# Altium schematic sheet IF_Amp.SchDoc
size A3; SheetNumber: 8; SheetTotal: 8
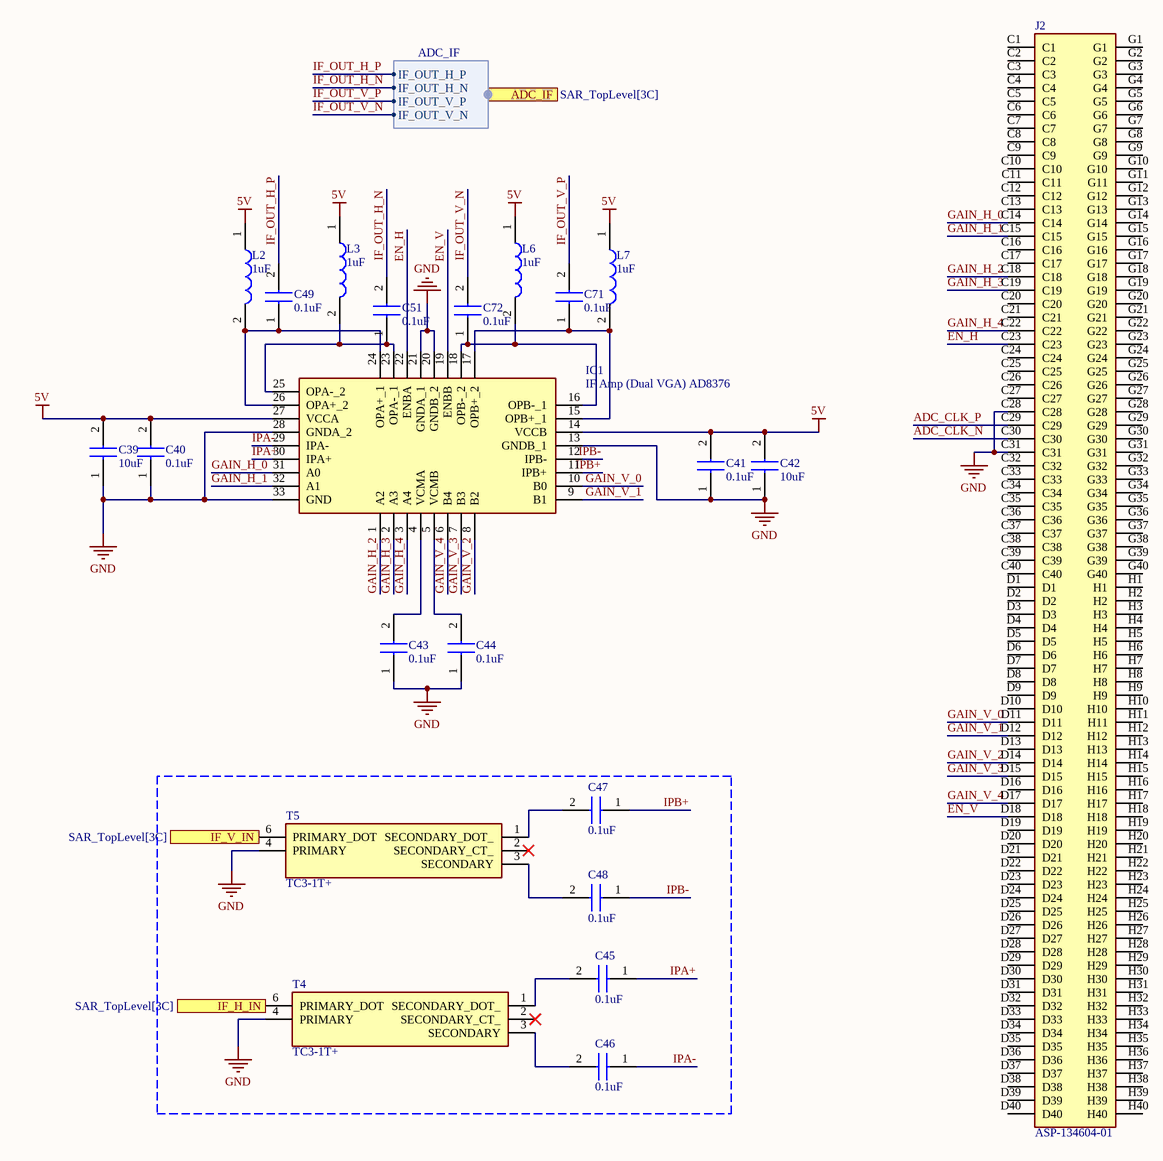
[diagram p0: IF_Amp.SchDoc]

## Parts
C39  10uF  [C1206_FT]
C40  0.1uF  [C0402C104J4RACTU]
C41  0.1uF  [C0402C104J4RACTU]
C42  10uF  [C1206_FT]
C43  0.1uF  [C0402C104J4RACTU]
C44  0.1uF  [C0402C104J4RACTU]
C45  0.1uF  [C0402C104J4RACTU]
C46  0.1uF  [C0402C104J4RACTU]
C47  0.1uF  [C0402C104J4RACTU]
C48  0.1uF  [C0402C104J4RACTU]
C49  0.1uF  [C0402C104J4RACTU]
C51  0.1uF  [C0402C104J4RACTU]
C71  0.1uF  [C0402C104J4RACTU]
C72  0.1uF  [C0402C104J4RACTU]
IC1  IF Amp (Dual VGA) AD8376  [QFN50P500X500X80-33N-D]
J2  ASP-134604-01  [ASP13460401]
L2  1uF  [7447610310]
L3  1uF  [7447610310]
L6  1uF  [7447610310]
L7  1uF  [7447610310]
T4  TC3-1T+  [TC31T]
T5  TC3-1T+  [TC31T]

## Ports
ADC_IF (harness ADC_IF, see SAR_TopLevel[3C]), IF_H_IN (in, see SAR_TopLevel[3C]), IF_V_IN (in, see SAR_TopLevel[3C])

## Harnesses
ADC_IF: IF_OUT_V_N, IF_OUT_H_N, IF_OUT_H_P, IF_OUT_V_P

## Nets
5V: C39.2 C40.2 C41.2 C42.2 IC1.14(VCCB) IC1.27(VCCA) L2.1 L3.1 L6.1 L7.1
GND: C39.1 C40.1 C41.1 C42.1 C43.1 C44.1 IC1.13(GNDB_1) IC1.20(GNDB_2) IC1.21(GNDA_1) IC1.28(GNDA_2) IC1.33(GND) J2.C28 J2.C31 T4.4(PRIMARY) T5.4(PRIMARY)
ADC_CLK_N: J2.C30
ADC_CLK_P: J2.C29
EN_H: IC1.22(ENBA) J2.C23
EN_V: IC1.19(ENBB) J2.D18
GAIN_H_0: IC1.31(A0) J2.C14
GAIN_H_1: IC1.32(A1) J2.C15
GAIN_H_2: IC1.1(A2) J2.C18
GAIN_H_3: IC1.2(A3) J2.C19
GAIN_H_4: IC1.3(A4) J2.C22
GAIN_V_0: IC1.10(B0) J2.D11
GAIN_V_1: IC1.9(B1) J2.D12
GAIN_V_2: IC1.8(B2) J2.D14
GAIN_V_3: IC1.7(B3) J2.D15
GAIN_V_4: IC1.6(B4) J2.D17
IF_H_IN: T4.6(PRIMARY_DOT) ; port IF_H_IN
IF_OUT_H_N: C51.2 ; port ADC_IF.IF_OUT_H_N
IF_OUT_H_P: C49.2 ; port ADC_IF.IF_OUT_H_P
IF_OUT_V_N: C72.2 ; port ADC_IF.IF_OUT_V_N
IF_OUT_V_P: C71.2 ; port ADC_IF.IF_OUT_V_P
IF_V_IN: T5.6(PRIMARY_DOT) ; port IF_V_IN
IPA+: C45.1 IC1.30(IPA+)
IPA-: C46.1 IC1.29(IPA-)
IPB+: C47.1 IC1.11(IPB+)
IPB-: C48.1 IC1.12(IPB-)
NetC43_2: C43.2 IC1.4(VCMA)
NetC44_2: C44.2 IC1.5(VCMB)
NetC45_2: C45.2 T4.1(SECONDARY_DOT_)
NetC46_2: C46.2 T4.3(SECONDARY)
NetC47_2: C47.2 T5.1(SECONDARY_DOT_)
NetC48_2: C48.2 T5.3(SECONDARY)
NetC49_1: C49.1 IC1.24(OPA+_1) IC1.26(OPA+_2) L2.2
NetC51_1: C51.1 IC1.23(OPA-_1) IC1.25(OPA-_2) L3.2
NetC71_1: C71.1 IC1.15(OPB+_1) IC1.17(OPB+_2) L7.2
NetC72_1: C72.1 IC1.16(OPB-_1) IC1.18(OPB-_2) L6.2

Not connected (* = marked no-connect by the designer): J2 C1 C2 C3 C4 C5 C6 C7 C8 C9 C10 C11 C12 C13 C16 C17 C20 C21 C24 C25 C26 C27 C32 C33 C34 C35 C36 C37 C38 C39 C40 D1 D2 D3 D4 D5 D6 D7 D8 D9 D10 D13 D16 D19 D20 D21 D22 D23 D24 D25 D26 D27 D28 D29 D30 D31 D32 D33 D34 D35 D36 D37 D38 D39 D40 G1 G2 G3 G4 G5 G6 G7 G8 G9 G10 G11 G12 G13 G14 G15 G16 G17 G18 G19 G20 G21 G22 G23 G24 G25 G26 G27 G28 G29 G30 G31 G32 G33 G34 G35 G36 G37 G38 G39 G40 H1 H2 H3 H4 H5 H6 H7 H8 H9 H10 H11 H12 H13 H14 H15 H16 H17 H18 H19 H20 H21 H22 H23 H24 H25 H26 H27 H28 H29 H30 H31 H32 H33 H34 H35 H36 H37 H38 H39 H40; T4 2(SECONDARY_CT_)*; T5 2(SECONDARY_CT_)*

## Library data of the parts
C39 C42 = 1206 10uF Capacitor: C1206X106M3RACAUTO; Manufacturer_Name: Yageo Group; Datasheet Link: https://www.yageogroup.com/content/datasheet/asset/file/KEM_C1078_X7R_FT-CAP_AUTO_SMD; Manufacturer_Part_Number: C1206X106M3RACAUTO; Mouser Part Number: 80-C1206X106M3RAUTO; Mouser Price/Stock: https://www.mouser.co.uk/ProductDetail/KEMET/C1206X106M3RACAUTO?qs=HXFqYaX1Q2xSroSoadzbnw%3D%3D; Arrow Part Number: C1206X106M3RACAUTO; Arrow Price/Stock: https://www.arrow.com/en/products/c1206x106m3racauto/kemet-corporation?utm_currency=USD&region=nac
C40 C41 C43-C49 C51 C71 C72 = 0402 0.1uF Capacitor: C0402C104K4RACTU; Manufacturer_Name: Yageo Group; Datasheet Link: https://content.kemet.com/datasheets/KEM_C1002_X7R_SMD.pdf; Height: 0.55mm; Manufacturer_Part_Number: C0402C104K4RACTU; Mouser Part Number: 80-C0402C104K4R; Mouser Price/Stock: https://www.mouser.co.uk/ProductDetail/KEMET/C0402C104K4RACTU?qs=DBJr%252BvBUjU54jK7d4uAeew%3D%3D; Arrow Part Number: C0402C104K4RACTU; Arrow Price/Stock: https://www.arrow.com/en/products/c0402c104k4ractu/kemet-corporation.html?utm_currency=USD&region=nac
IC1 = IF Amp (Dual VGA) AD8376: AD8376ACPZ-R7; Manufacturer_Name: Analog Devices; Datasheet Link: https://www.analog.com/media/en/technical-documentation/data-sheets/ad8376.pdf; Height: 0.8mm; Manufacturer_Part_Number: AD8376ACPZ-R7; Mouser Part Number: 584-AD8376ACPZ-R7; Mouser Price/Stock: https://www.mouser.co.uk/ProductDetail/Analog-Devices/AD8376ACPZ-R7?qs=%2FtpEQrCGXCx%252BVfPSiG%2FcvQ%3D%3D; Arrow Part Number: AD8376ACPZ-R7; Arrow Price/Stock: https://www.arrow.com/en/products/ad8376acpz-r7/analog-devices?region=nac
J2 = ASP-134604-01: Connector; Manufacturer_Name: SAMTEC; Datasheet Link: https://componentsearchengine.com/Datasheets/2/ASP-134604-01.pdf; Height: 7.11mm; Manufacturer_Part_Number: ASP-134604-01; Mouser Part Number: 200-ASP-134604-01; Mouser Price/Stock: https://www.mouser.co.uk/ProductDetail/Samtec/ASP-134604-01?qs=Rp%2FUEJiACm00i8g2mQ6XNw%3D%3D; Arrow Part Number: ASP-134604-01; Arrow Price/Stock: https://www.arrow.com/en/products/asp-134604-01/samtec.html?utm_currency=USD&region=nac
L2 L3 L6 L7 = 0603 1uH Inductor: 7447610310; Manufacturer_Name: Wurth Elektronik; Datasheet Link: https://www.we-online.com/catalog/datasheet/7447610310.pdf; Height: 0.9mm; Manufacturer_Part_Number: 7447610310
T4 T5 = TC3-1T+: Transformer; Manufacturer_Name: Mini-Circuits; Datasheet Link: https://datasheet.datasheetarchive.com/originals/distributors/Datasheets-28/DSA-546328.pdf; Height: 4mm; Manufacturer_Part_Number: TC3-1T+; Mouser Part Number: 139-TC3-1T; Mouser Price/Stock: https://www.mouser.co.uk/ProductDetail/Mini-Circuits/TC3-1T%2b?qs=xZ%2FP%252Ba9zWqZHx%2FHxCJInOw%3D%3D